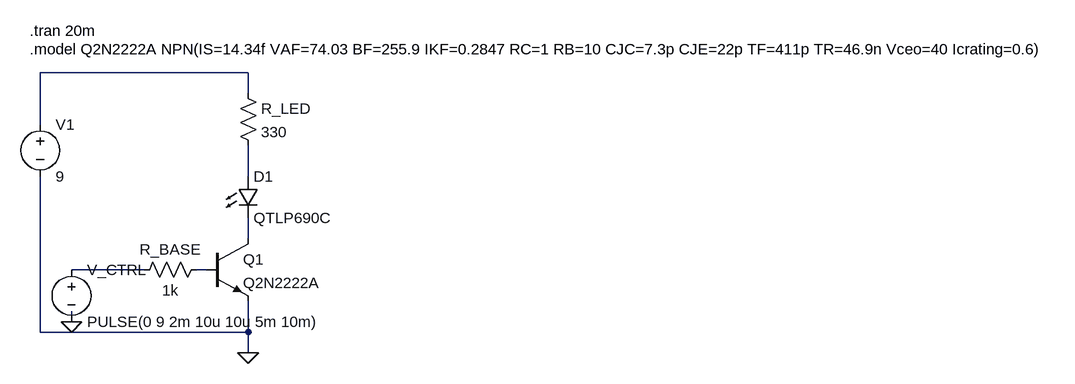
[diagram p0: schematic Circuito_2N2222A_LTspice.asc]
Circuito_2N2222A_LTspice.asc, the LTspice schematic file:
Version 4
SHEET 1 880 680
WIRE 160 128 160 208
WIRE 160 128 480 128
WIRE 480 128 480 160
WIRE 480 240 480 288
WIRE 480 352 480 384
WIRE 208 432 320 432
WIRE 400 432 416 432
WIRE 160 288 160 528
WIRE 480 480 480 528
WIRE 160 528 480 528
WIRE 480 528 480 560
FLAG 480 560 0
SYMBOL voltage 160 192 R0
WINDOW 123 0 0 Left 0
WINDOW 39 0 0 Left 0
SYMATTR InstName V1
SYMATTR Value 9
SYMBOL res 464 144 R0
SYMATTR InstName R_LED
SYMATTR Value 330
SYMBOL LED 464 288 R0
SYMATTR InstName D1
SYMATTR Value QTLP690C
SYMBOL npn 416 384 R0
SYMATTR InstName Q1
SYMATTR Value Q2N2222A
SYMBOL res 416 416 R90
WINDOW 0 0 56 VBottom 2
WINDOW 3 32 56 VTop 2
SYMATTR InstName R_BASE
SYMATTR Value 1k
SYMBOL voltage 208 416 R0
WINDOW 123 0 0 Left 0
WINDOW 39 0 0 Left 0
SYMATTR InstName V_CTRL
SYMATTR Value PULSE(0 9 2m 10u 10u 5m 10m)
FLAG 208 512 0
WIRE 208 496 208 512
TEXT 144 64 Left 2 !.tran 20m
TEXT 144 92 Left 2 !.model Q2N2222A NPN(IS=14.34f VAF=74.03 BF=255.9 IKF=0.2847 RC=1 RB=10 CJC=7.3p CJE=22p TF=411p TR=46.9n Vceo=40 Icrating=0.6)

The netlist it stands for:
* Circuito_2N2222A_LTspice.asc
V1 N001 0 9
R_LED N001 N002 330
D1 N002 N003 QTLP690C
Q1 N003 N005 0 0 Q2N2222A
R_BASE N005 N004 1k
V_CTRL N004 0 PULSE(0 9 2m 10u 10u 5m 10m)
.model D D
.lib standard.dio
.model NPN NPN
.model PNP PNP
.lib standard.bjt
.tran 20m
.model Q2N2222A NPN(IS=14.34f VAF=74.03 BF=255.9 IKF=0.2847 RC=1 RB=10 CJC=7.3p CJE=22p TF=411p TR=46.9n Vceo=40 Icrating=0.6)
.backanno
.end